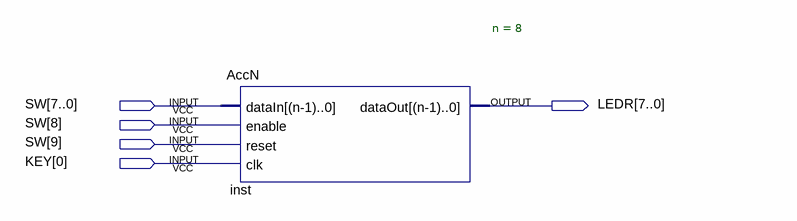
[diagram p0: schematic sheet]
// Quartus schematic AccN_Demo.bdf as structural Verilog: 1 symbols, 5 pins
module AccN_Demo (
  input  [9:0] SW,
  input  [0:0] KEY,
  output [7:0] LEDR
);

  AccN #(.n(8)) inst (.dataIn(SW[7:0]), .enable(SW[8]), .reset(SW[9]), .clk(KEY[0]), .dataOut(LEDR));
endmodule
